# Altium schematic sheet Connector-Sheet.SchDoc
size 420 x 297 mm; SheetNumber: 4; SheetTotal: 4
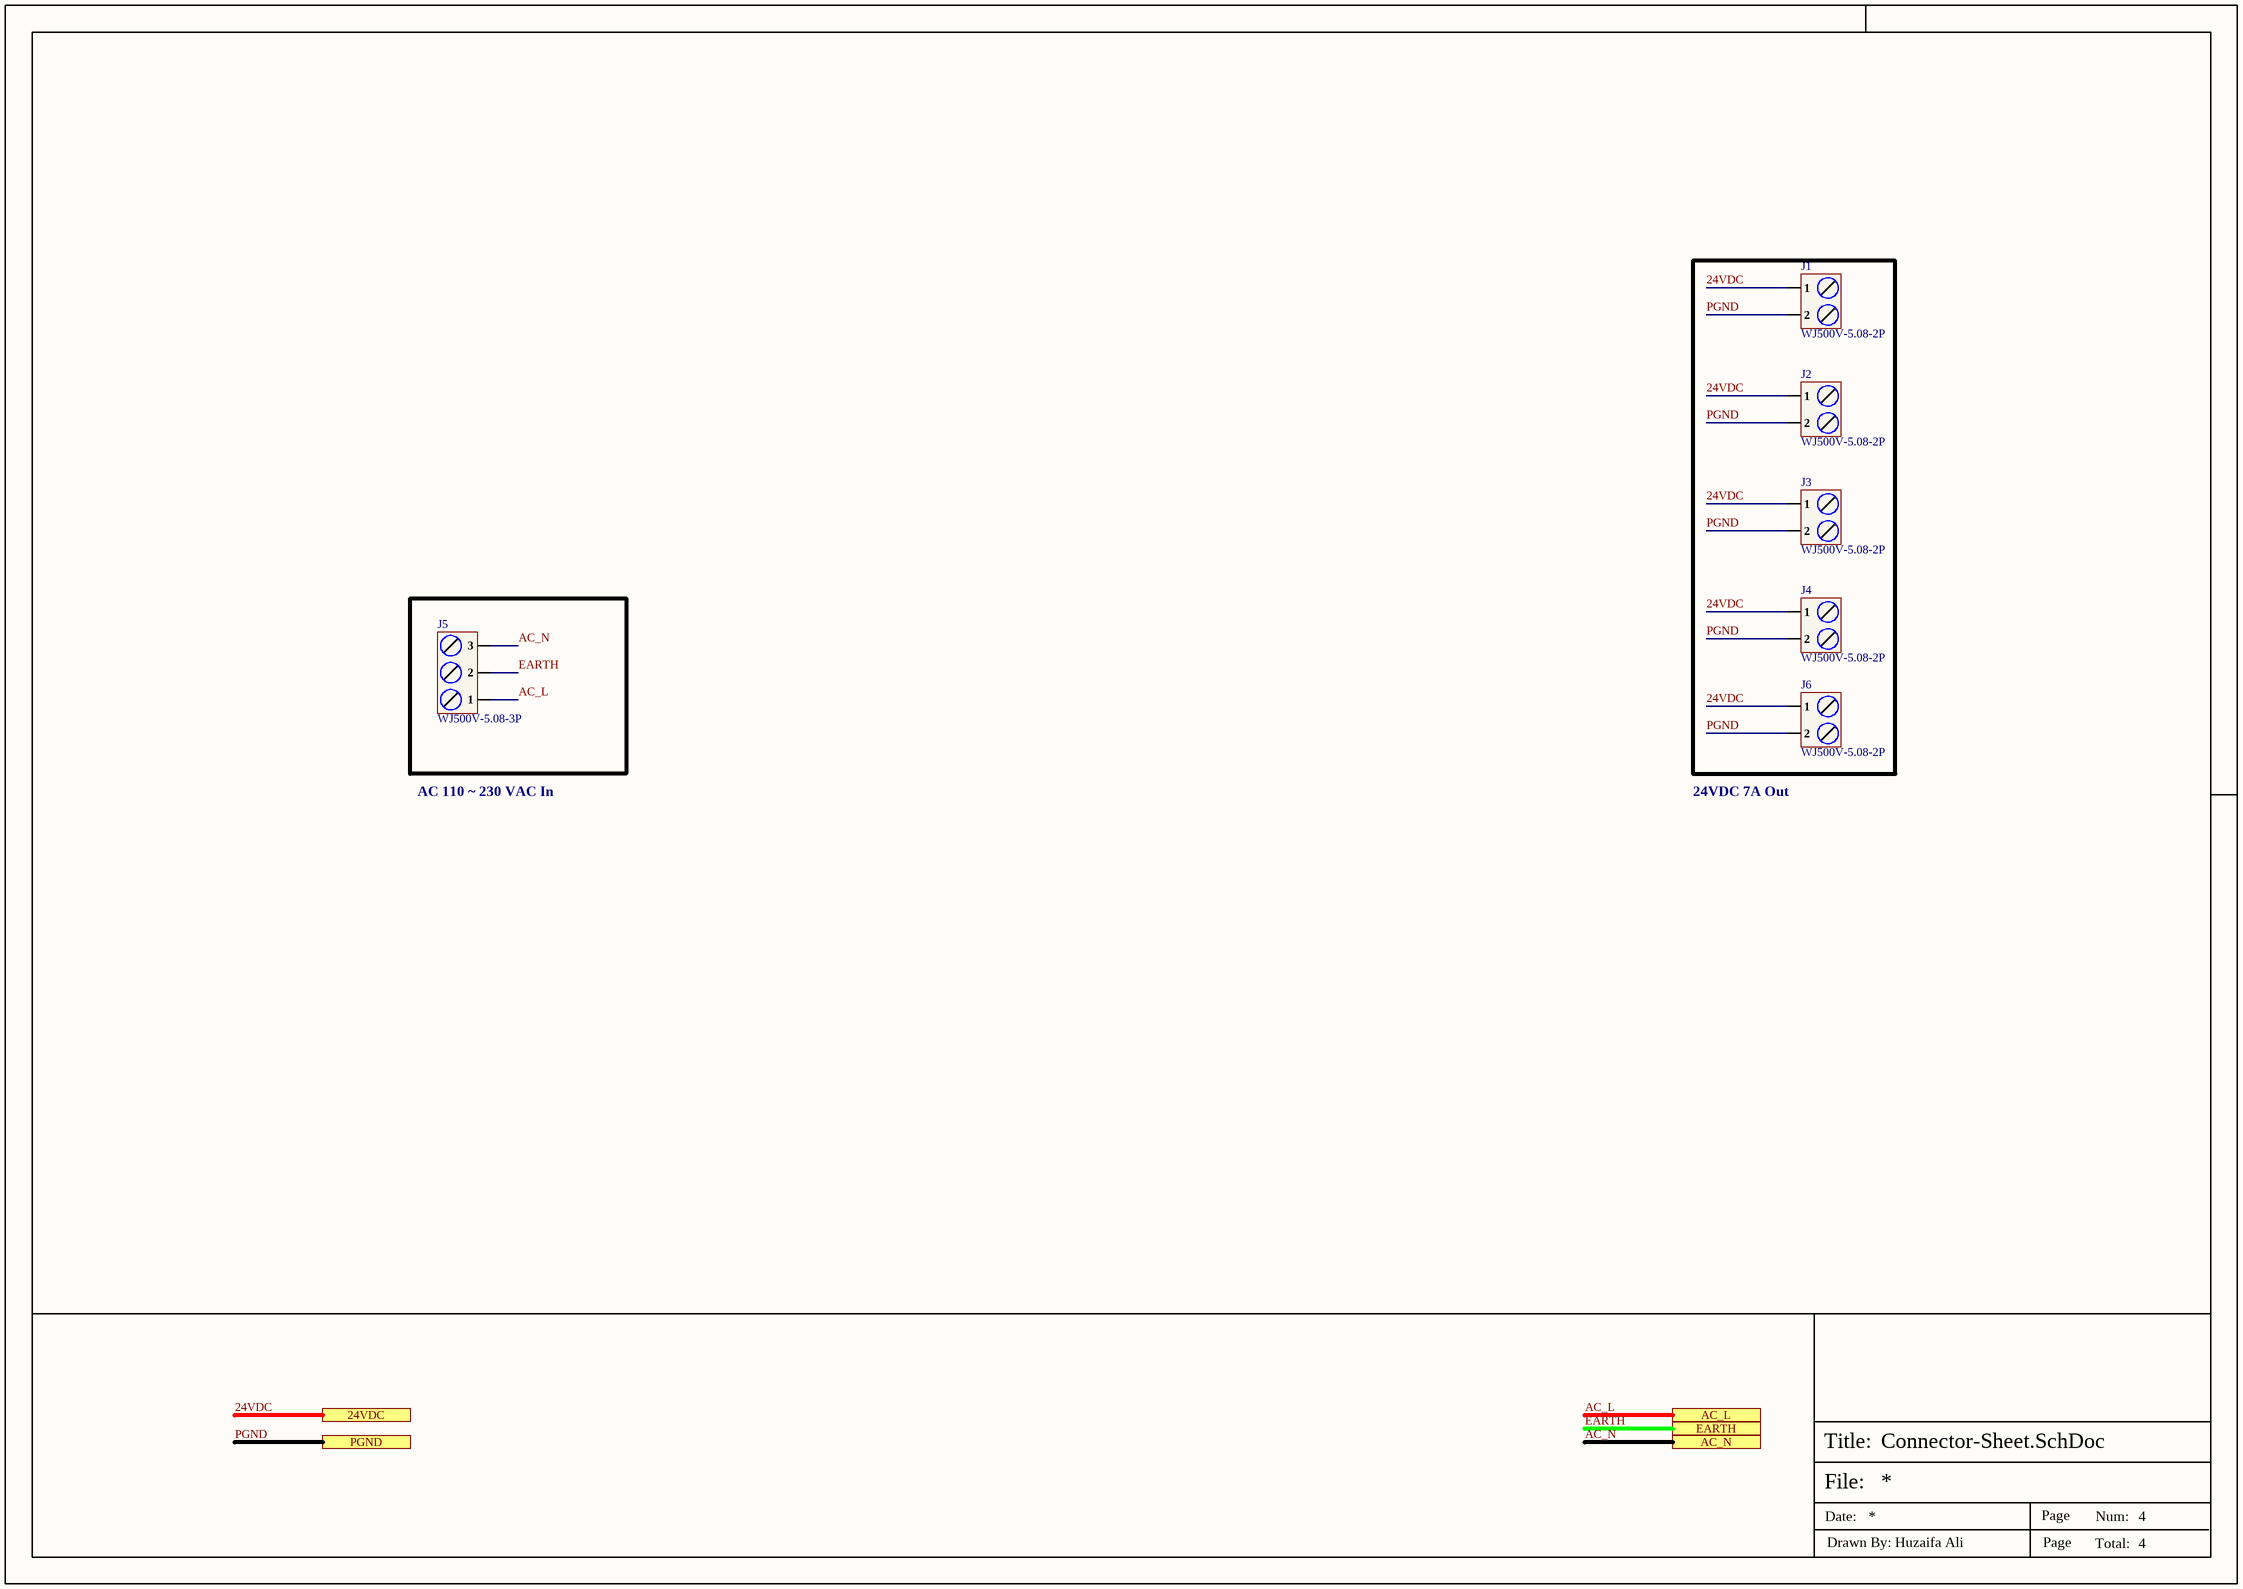
[diagram p0: Connector-Sheet.SchDoc]

## Parts
J1  WJ500V-5.08-2P  [WJ500V-5.08-2P]
J2  WJ500V-5.08-2P  [WJ500V-5.08-2P]
J3  WJ500V-5.08-2P  [WJ500V-5.08-2P]
J4  WJ500V-5.08-2P  [WJ500V-5.08-2P]
J5  WJ500V-5.08-3P  [WJ500V-5.08-3P]
J6  WJ500V-5.08-2P  [WJ500V-5.08-2P]

## Ports
24VDC (see Top-Sheet[3B], Power_Controller-Sheet[1D]), AC_L (see Top-Sheet[3B], PFC-Sheet[4D]), AC_N (see Top-Sheet[3B], PFC-Sheet[4D]), EARTH (see Top-Sheet[3B], PFC-Sheet[4D]), PGND (see Top-Sheet[3B], Power_Controller-Sheet[1D])

## Nets
24VDC: J1.1 J2.1 J3.1 J4.1 J6.1 ; port 24VDC
AC_L: J5.1 ; port AC_L
AC_N: J5.3 ; port AC_N
EARTH: J5.2 ; port EARTH
PGND: J1.2 J2.2 J3.2 J4.2 J6.2 ; port PGND

## Notes on the sheet
- AC 110 ~ 230 VAC In
- 24VDC 7A Out
- File:
- Title:
- Date:
- Page
- Num:
- Total:
- Drawn By: Huzaifa Ali

## Library data of the parts
J1-J4 J6 = WJ500V-5.08-2P: 1x2P 5.08mm 2.5 1 2 18A -40℃~+105℃ 250V Green 14~30 Direct Insert Plugin,P=5.08mm Screw Terminal Blocks ROHS; Manufacturer: Kangnex; Item Type: Terminal Block; LCSC Part Number: C8465; Manufacturer Part Number: WJ500V-5.08-2P; RoHS: No
J5 = WJ500V-5.08-3P: 1x3P 18A -40℃~+105℃ 250V Green 14~30 Straight pin 5.08mm 2.5 1 3 Plugin,P=5.08mm Screw terminal ROHS; Manufacturer: Ningbo Kangnex Elec; Item Type: Terminal Block; Manufacturer Part Number: WJ500V-5.08-3P; Package: Plugin,P=5.08mm; LCSC Part Number: C72334; ComponentLink1Description: LCSC; ComponentLink1URL: https://www.lcsc.com/product-detail/Screw-terminal_Ningbo-Kangnex-Elec-WJ500V-5-08-3P_C72334.html